# Altium schematic sheet HMS.PhaoDien.SchDoc
size A4
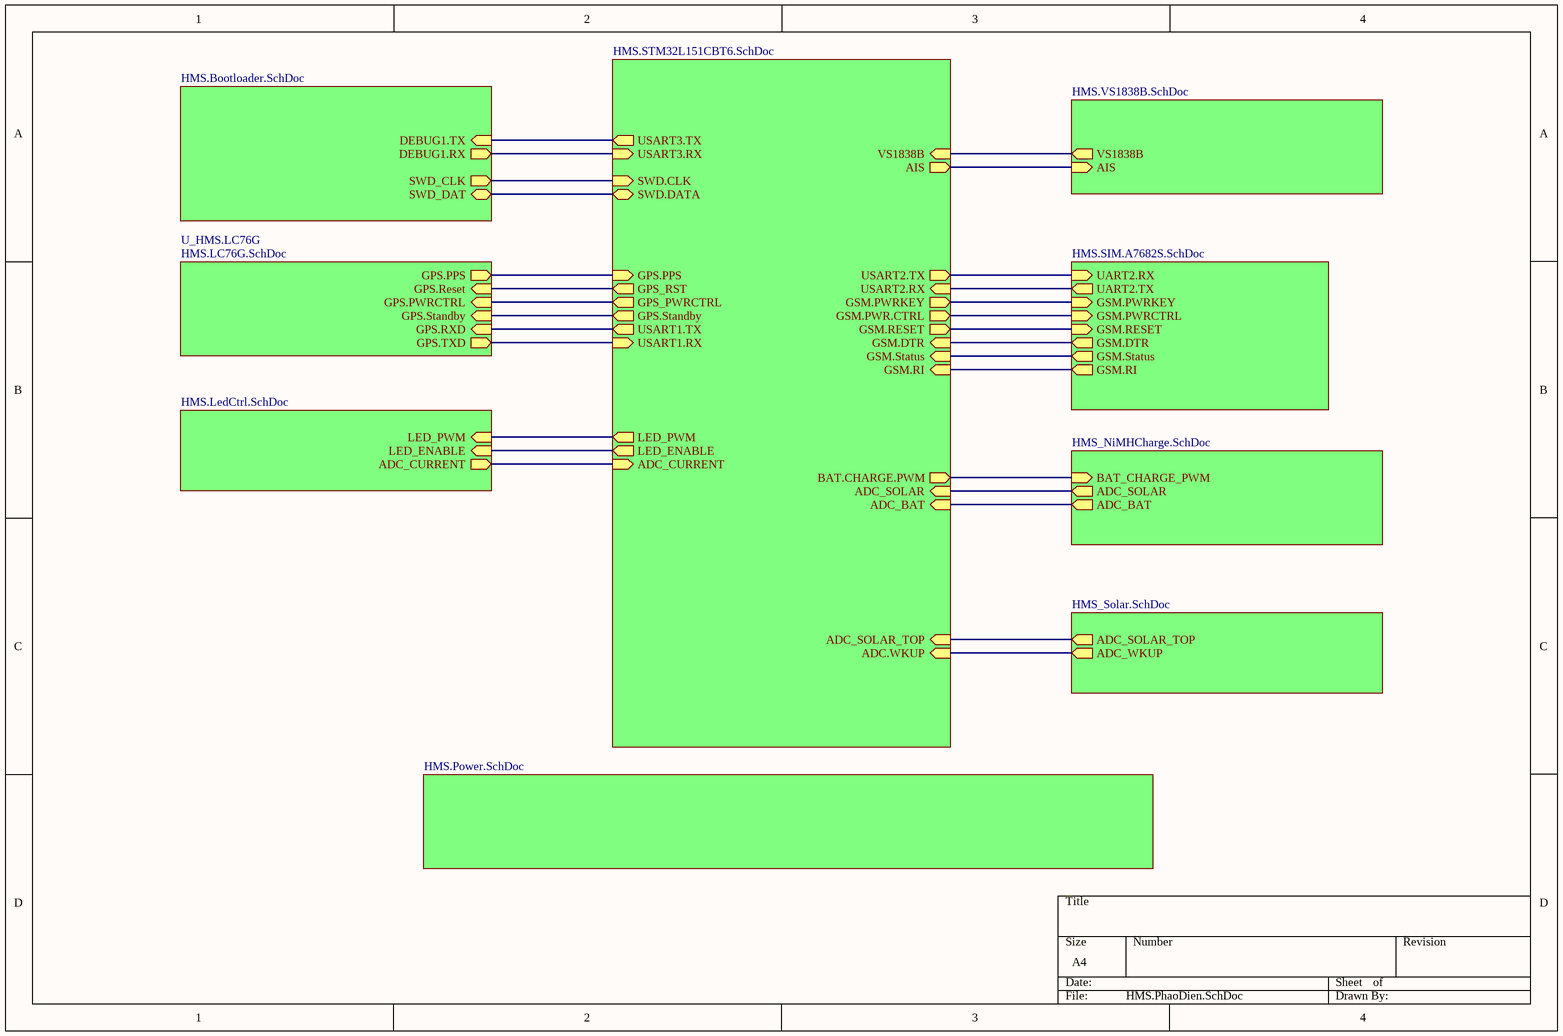
[diagram p0: HMS.PhaoDien.SchDoc]

## Sub-sheets
U_HMS.LC76G = HMS.LC76G.SchDoc: GPS.TXD (out), GPS.RXD (in), GPS.Reset (in), GPS.PWRCTRL (in), GPS.PPS (out), GPS.Standby (in)
U_HMS.SIM.A7677S = HMS.SIM.A7682S.SchDoc: GSM.PWRCTRL (in), GSM.PWRKEY (in), GSM.RESET (in), UART2.RX (in), UART2.TX (out), GSM.DTR (out), GSM.Status (out), GSM.RI (out)
? = HMS.STM32L151CBT6.SchDoc: SWD.DATA (bidir), SWD.CLK (in), LED_PWM (out), LED_ENABLE (out), ADC_CURRENT (in), ADC_SOLAR_TOP (in), ADC_BAT (in), ADC_SOLAR (in), BAT.CHARGE.PWM (out), GPS_RST (out), GPS_PWRCTRL (out), GSM.PWRKEY (out), VS1838B (in), AIS (out), USART1.TX (out), USART1.RX (in), USART2.TX (out), USART2.RX (in), GSM.PWR.CTRL (out), GSM.RESET (out), USART3.TX (out), USART3.RX (in), ADC.WKUP (in), GPS.PPS (in), GSM.RI (in), GSM.Status (in), GSM.DTR (in), GPS.Standby (out)
? = HMS.Bootloader.SchDoc: SWD_CLK (out), SWD_DAT (bidir), DEBUG1.TX (in), DEBUG1.RX (out)
? = HMS.LedCtrl.SchDoc: ADC_CURRENT (out), LED_ENABLE (in), LED_PWM (in)
? = HMS.Power.SchDoc: no entries
? = HMS.VS1838B.SchDoc: VS1838B (out), AIS (in)
? = HMS_NiMHCharge.SchDoc: ADC_SOLAR (out), BAT_CHARGE_PWM (in), ADC_BAT (out)
? = HMS_Solar.SchDoc: ADC_SOLAR_TOP (out), ADC_WKUP (out)

## Nets
(unnamed): sheet /SWD.DATA, sheet /SWD_DAT
(unnamed): sheet /SWD.CLK, sheet /SWD_CLK
(unnamed): sheet /LED_PWM, sheet /LED_PWM
(unnamed): sheet /LED_ENABLE, sheet /LED_ENABLE
(unnamed): sheet /ADC_CURRENT, sheet /ADC_CURRENT
(unnamed): sheet /ADC_SOLAR_TOP, sheet /ADC_SOLAR_TOP
(unnamed): sheet /ADC_BAT, sheet /ADC_BAT
(unnamed): sheet /ADC_SOLAR, sheet /ADC_SOLAR
(unnamed): sheet /BAT.CHARGE.PWM, sheet /BAT_CHARGE_PWM
(unnamed): sheet /GPS_RST, sheet U_HMS.LC76G/GPS.Reset
(unnamed): sheet /GPS_PWRCTRL, sheet U_HMS.LC76G/GPS.PWRCTRL
(unnamed): sheet /GSM.PWRKEY, sheet U_HMS.SIM.A7677S/GSM.PWRKEY
(unnamed): sheet /VS1838B, sheet /VS1838B
(unnamed): sheet /AIS, sheet /AIS
(unnamed): sheet /USART1.TX, sheet U_HMS.LC76G/GPS.RXD
(unnamed): sheet /USART1.RX, sheet U_HMS.LC76G/GPS.TXD
(unnamed): sheet /USART2.TX, sheet U_HMS.SIM.A7677S/UART2.RX
(unnamed): sheet /USART2.RX, sheet U_HMS.SIM.A7677S/UART2.TX
(unnamed): sheet /GSM.PWR.CTRL, sheet U_HMS.SIM.A7677S/GSM.PWRCTRL
(unnamed): sheet /GSM.RESET, sheet U_HMS.SIM.A7677S/GSM.RESET
(unnamed): sheet /USART3.TX, sheet /DEBUG1.TX
(unnamed): sheet /USART3.RX, sheet /DEBUG1.RX
(unnamed): sheet /ADC.WKUP, sheet /ADC_WKUP
(unnamed): sheet /GPS.PPS, sheet U_HMS.LC76G/GPS.PPS
(unnamed): sheet /GSM.RI, sheet U_HMS.SIM.A7677S/GSM.RI
(unnamed): sheet /GSM.Status, sheet U_HMS.SIM.A7677S/GSM.Status
(unnamed): sheet /GSM.DTR, sheet U_HMS.SIM.A7677S/GSM.DTR
(unnamed): sheet /GPS.Standby, sheet U_HMS.LC76G/GPS.Standby